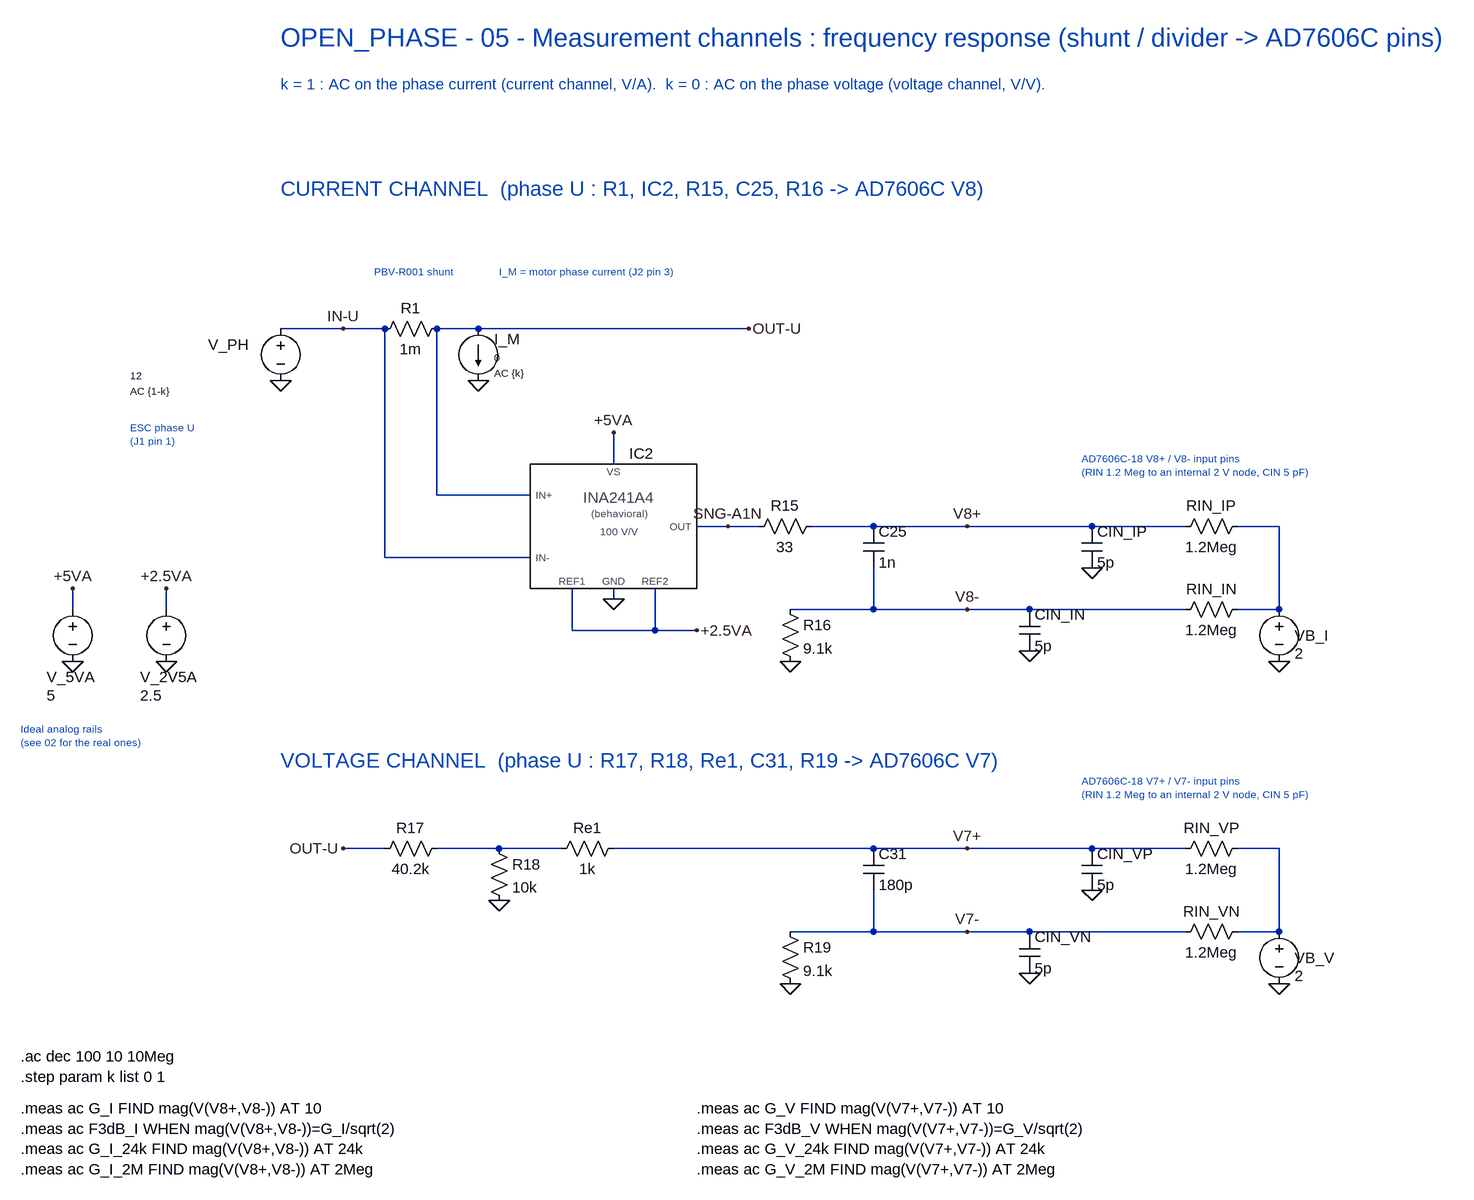
[diagram p0: schematic 05_Measurement_Channels_AC.asc]
05_Measurement_Channels_AC.asc, the LTspice schematic file:
Version 4
SHEET 1 2100 1500
WIRE 0 0 96 0
WIRE 96 0 160 0
WIRE 240 0 304 0
WIRE 304 0 720 0
WIRE 240 0 240 256
WIRE 240 256 384 256
WIRE 160 0 160 352
WIRE 160 352 384 352
WIRE 512 208 512 160
WIRE 512 400 512 416
WIRE 448 400 448 464
WIRE 448 464 576 464
WIRE 576 464 576 400
WIRE 576 464 640 464
WIRE 640 304 688 304
WIRE 688 304 736 304
WIRE 912 368 912 432
WIRE 1472 304 1536 304
WIRE 1536 304 1536 432
WIRE 1472 432 1536 432
WIRE 816 304 912 304
WIRE 912 304 1056 304
WIRE 1056 304 1248 304
WIRE 1248 304 1392 304
WIRE 784 432 912 432
WIRE 912 432 1056 432
WIRE 1056 432 1152 432
WIRE 1152 432 1392 432
WIRE 96 800 160 800
WIRE 240 800 336 800
WIRE 336 800 432 800
WIRE 912 864 912 928
WIRE 1472 800 1536 800
WIRE 1536 800 1536 928
WIRE 1472 928 1536 928
WIRE 512 800 912 800
WIRE 912 800 1056 800
WIRE 1056 800 1248 800
WIRE 1248 800 1392 800
WIRE 784 928 912 928
WIRE 912 928 1056 928
WIRE 1056 928 1152 928
WIRE 1152 928 1392 928
WIRE -320 432 -320 400
WIRE -176 432 -176 400
FLAG 0 80 0
FLAG 304 80 0
FLAG 96 0 IN-U
FLAG 720 0 OUT-U
FLAG 512 160 +5VA
FLAG 512 416 0
FLAG 640 464 +2.5VA
FLAG 688 304 SNG-A1N
FLAG 784 512 0
FLAG 1536 512 0
FLAG 1248 368 0
FLAG 1152 496 0
FLAG 1056 304 V8+
FLAG 1056 432 V8-
FLAG 96 800 OUT-U
FLAG 336 880 0
FLAG 784 1008 0
FLAG 1536 1008 0
FLAG 1248 864 0
FLAG 1152 992 0
FLAG 1056 800 V7+
FLAG 1056 928 V7-
FLAG -320 400 +5VA
FLAG -320 512 0
FLAG -176 400 +2.5VA
FLAG -176 512 0
SYMBOL voltage 0 -16 R0
WINDOW 0 -112 40 Left 2
WINDOW 3 -232 88 Left 1
WINDOW 123 -232 112 Left 1
SYMATTR InstName V_PH
SYMATTR Value 12
SYMATTR Value2 AC {1-k}
SYMBOL res 144 16 R270
WINDOW 0 32 56 VTop 2
WINDOW 3 0 56 VBottom 2
SYMATTR InstName R1
SYMATTR Value 1m
SYMBOL current 304 0 R0
WINDOW 0 24 16 Left 2
WINDOW 3 24 44 Left 1
WINDOW 123 24 68 Left 1
SYMATTR InstName I_M
SYMATTR Value 0
SYMATTR Value2 AC {k}
SYMBOL INA241A4_behav 512 304 R0
SYMATTR InstName IC2
SYMBOL res 720 320 R270
WINDOW 0 32 56 VTop 2
WINDOW 3 0 56 VBottom 2
SYMATTR InstName R15
SYMATTR Value 33
SYMBOL cap 896 304 R0
SYMATTR InstName C25
SYMATTR Value 1n
SYMBOL res 768 416 R0
SYMATTR InstName R16
SYMATTR Value 9.1k
SYMBOL res 1376 320 R270
WINDOW 0 32 56 VTop 2
WINDOW 3 0 56 VBottom 2
SYMATTR InstName RIN_IP
SYMATTR Value 1.2Meg
SYMBOL res 1376 448 R270
WINDOW 0 32 56 VTop 2
WINDOW 3 0 56 VBottom 2
SYMATTR InstName RIN_IN
SYMATTR Value 1.2Meg
SYMBOL voltage 1536 416 R0
WINDOW 0 24 56 Left 2
WINDOW 3 24 84 Left 2
SYMATTR InstName VB_I
SYMATTR Value 2
SYMBOL cap 1232 304 R0
SYMATTR InstName CIN_IP
SYMATTR Value 5p
SYMBOL cap 1136 432 R0
SYMATTR InstName CIN_IN
SYMATTR Value 5p
SYMBOL res 144 816 R270
WINDOW 0 32 56 VTop 2
WINDOW 3 0 56 VBottom 2
SYMATTR InstName R17
SYMATTR Value 40.2k
SYMBOL res 320 784 R0
SYMATTR InstName R18
SYMATTR Value 10k
SYMBOL res 416 816 R270
WINDOW 0 32 56 VTop 2
WINDOW 3 0 56 VBottom 2
SYMATTR InstName Re1
SYMATTR Value 1k
SYMBOL cap 896 800 R0
SYMATTR InstName C31
SYMATTR Value 180p
SYMBOL res 768 912 R0
SYMATTR InstName R19
SYMATTR Value 9.1k
SYMBOL res 1376 816 R270
WINDOW 0 32 56 VTop 2
WINDOW 3 0 56 VBottom 2
SYMATTR InstName RIN_VP
SYMATTR Value 1.2Meg
SYMBOL res 1376 944 R270
WINDOW 0 32 56 VTop 2
WINDOW 3 0 56 VBottom 2
SYMATTR InstName RIN_VN
SYMATTR Value 1.2Meg
SYMBOL voltage 1536 912 R0
WINDOW 0 24 56 Left 2
WINDOW 3 24 84 Left 2
SYMATTR InstName VB_V
SYMATTR Value 2
SYMBOL cap 1232 800 R0
SYMATTR InstName CIN_VP
SYMATTR Value 5p
SYMBOL cap 1136 928 R0
SYMATTR InstName CIN_VN
SYMATTR Value 5p
SYMBOL voltage -320 416 R0
WINDOW 0 -40 120 Left 2
WINDOW 3 -40 148 Left 2
SYMATTR InstName V_5VA
SYMATTR Value 5
SYMBOL voltage -176 416 R0
WINDOW 0 -40 120 Left 2
WINDOW 3 -40 148 Left 2
SYMATTR InstName V_2V5A
SYMATTR Value 2.5
TEXT 0 -448 Left 4 ;OPEN_PHASE - 05 - Measurement channels : frequency response (shunt / divider -> AD7606C pins)
TEXT 0 -376 Left 2 ;k = 1 : AC on the phase current (current channel, V/A).  k = 0 : AC on the phase voltage (voltage channel, V/V).
TEXT -232 152 Left 1 ;ESC phase U\n(J1 pin 1)
TEXT 336 -88 Left 1 ;I_M = motor phase current (J2 pin 3)
TEXT 144 -88 Left 1 ;PBV-R001 shunt
TEXT 1232 200 Left 1 ;AD7606C-18 V8+ / V8- input pins\n(RIN 1.2 Meg to an internal 2 V node, CIN 5 pF)
TEXT 0 -216 Left 3 ;CURRENT CHANNEL  (phase U : R1, IC2, R15, C25, R16 -> AD7606C V8)
TEXT 1232 696 Left 1 ;AD7606C-18 V7+ / V7- input pins\n(RIN 1.2 Meg to an internal 2 V node, CIN 5 pF)
TEXT 0 664 Left 3 ;VOLTAGE CHANNEL  (phase U : R17, R18, Re1, C31, R19 -> AD7606C V7)
TEXT -400 616 Left 1 ;Ideal analog rails\n(see 02 for the real ones)
TEXT -400 1120 Left 2 !.ac dec 100 10 10Meg\n.step param k list 0 1
TEXT -400 1200 Left 2 !.meas ac G_I FIND mag(V(V8+,V8-)) AT 10\n.meas ac F3dB_I WHEN mag(V(V8+,V8-))=G_I/sqrt(2)\n.meas ac G_I_24k FIND mag(V(V8+,V8-)) AT 24k\n.meas ac G_I_2M FIND mag(V(V8+,V8-)) AT 2Meg
TEXT 640 1200 Left 2 !.meas ac G_V FIND mag(V(V7+,V7-)) AT 10\n.meas ac F3dB_V WHEN mag(V(V7+,V7-))=G_V/sqrt(2)\n.meas ac G_V_24k FIND mag(V(V7+,V7-)) AT 24k\n.meas ac G_V_2M FIND mag(V(V7+,V7-)) AT 2Meg

The netlist it stands for:
* 05_Measurement_Channels_AC.asc
V_PH IN-U 0 12 AC {1-k}
R1 IN-U OUT-U 1m
I_M OUT-U 0 0 AC {k}
XIC2 OUT-U IN-U +2.5VA +2.5VA +5VA 0 SNG-A1N INA241A4_BEHAV  ; pins IN+ IN- REF1 REF2 VS GND OUT
R15 SNG-A1N V8+ 33
C25 V8+ V8- 1n
R16 V8- 0 9.1k
RIN_IP V8+ N001 1.2Meg
RIN_IN V8- N001 1.2Meg
VB_I N001 0 2
CIN_IP V8+ 0 5p
CIN_IN V8- 0 5p
R17 OUT-U N002 40.2k
R18 N002 0 10k
Re1 N002 V7+ 1k
C31 V7+ V7- 180p
R19 V7- 0 9.1k
RIN_VP V7+ N003 1.2Meg
RIN_VN V7- N003 1.2Meg
VB_V N003 0 2
CIN_VP V7+ 0 5p
CIN_VN V7- 0 5p
V_5VA +5VA 0 5
V_2V5A +2.5VA 0 2.5
* OPEN_PHASE - 05 - Measurement channels : frequency response (shunt / divider -> AD7606C pins)
* k = 1 : AC on the phase current (current channel, V/A).  k = 0 : AC on the phase voltage (voltage channel, V/V).
* ESC phase U
* (J1 pin 1)
* I_M = motor phase current (J2 pin 3)
* PBV-R001 shunt
* AD7606C-18 V8+ / V8- input pins
* (RIN 1.2 Meg to an internal 2 V node, CIN 5 pF)
* CURRENT CHANNEL  (phase U : R1, IC2, R15, C25, R16 -> AD7606C V8)
* AD7606C-18 V7+ / V7- input pins
* (RIN 1.2 Meg to an internal 2 V node, CIN 5 pF)
* VOLTAGE CHANNEL  (phase U : R17, R18, Re1, C31, R19 -> AD7606C V7)
* Ideal analog rails
* (see 02 for the real ones)
.ac dec 100 10 10Meg
.step param k list 0 1
.meas ac G_I FIND mag(V(V8+,V8-)) AT 10
.meas ac F3dB_I WHEN mag(V(V8+,V8-))=G_I/sqrt(2)
.meas ac G_I_24k FIND mag(V(V8+,V8-)) AT 24k
.meas ac G_I_2M FIND mag(V(V8+,V8-)) AT 2Meg
.meas ac G_V FIND mag(V(V7+,V7-)) AT 10
.meas ac F3dB_V WHEN mag(V(V7+,V7-))=G_V/sqrt(2)
.meas ac G_V_24k FIND mag(V(V7+,V7-)) AT 24k
.meas ac G_V_2M FIND mag(V(V7+,V7-)) AT 2Meg
.lib INA241A4_behav.sub
.backanno
.end